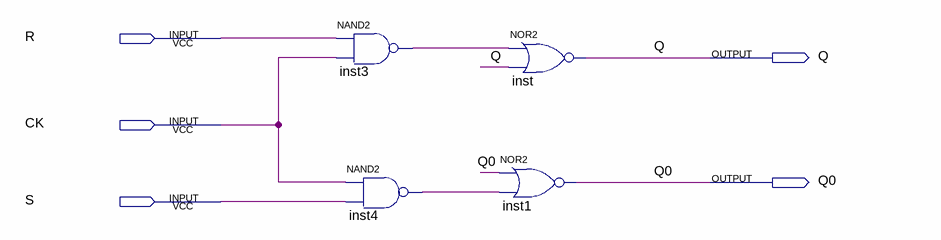
[diagram p0: schematic sheet]
// Quartus schematic FPGA_SR_Clock_Latch.bdf as structural Verilog: 4 symbols, 5 pins
module FPGA_SR_Clock_Latch (
  input  R,
  input  CK,
  input  S,
  output Q,
  output Q0
);

  wire inst3_out, inst4_out;

  nand inst3 (inst3_out, R, CK);
  nand inst4 (inst4_out, CK, S);
  nor inst (Q, inst3_out, Q);
  nor inst1 (Q0, Q0, inst4_out);
endmodule
